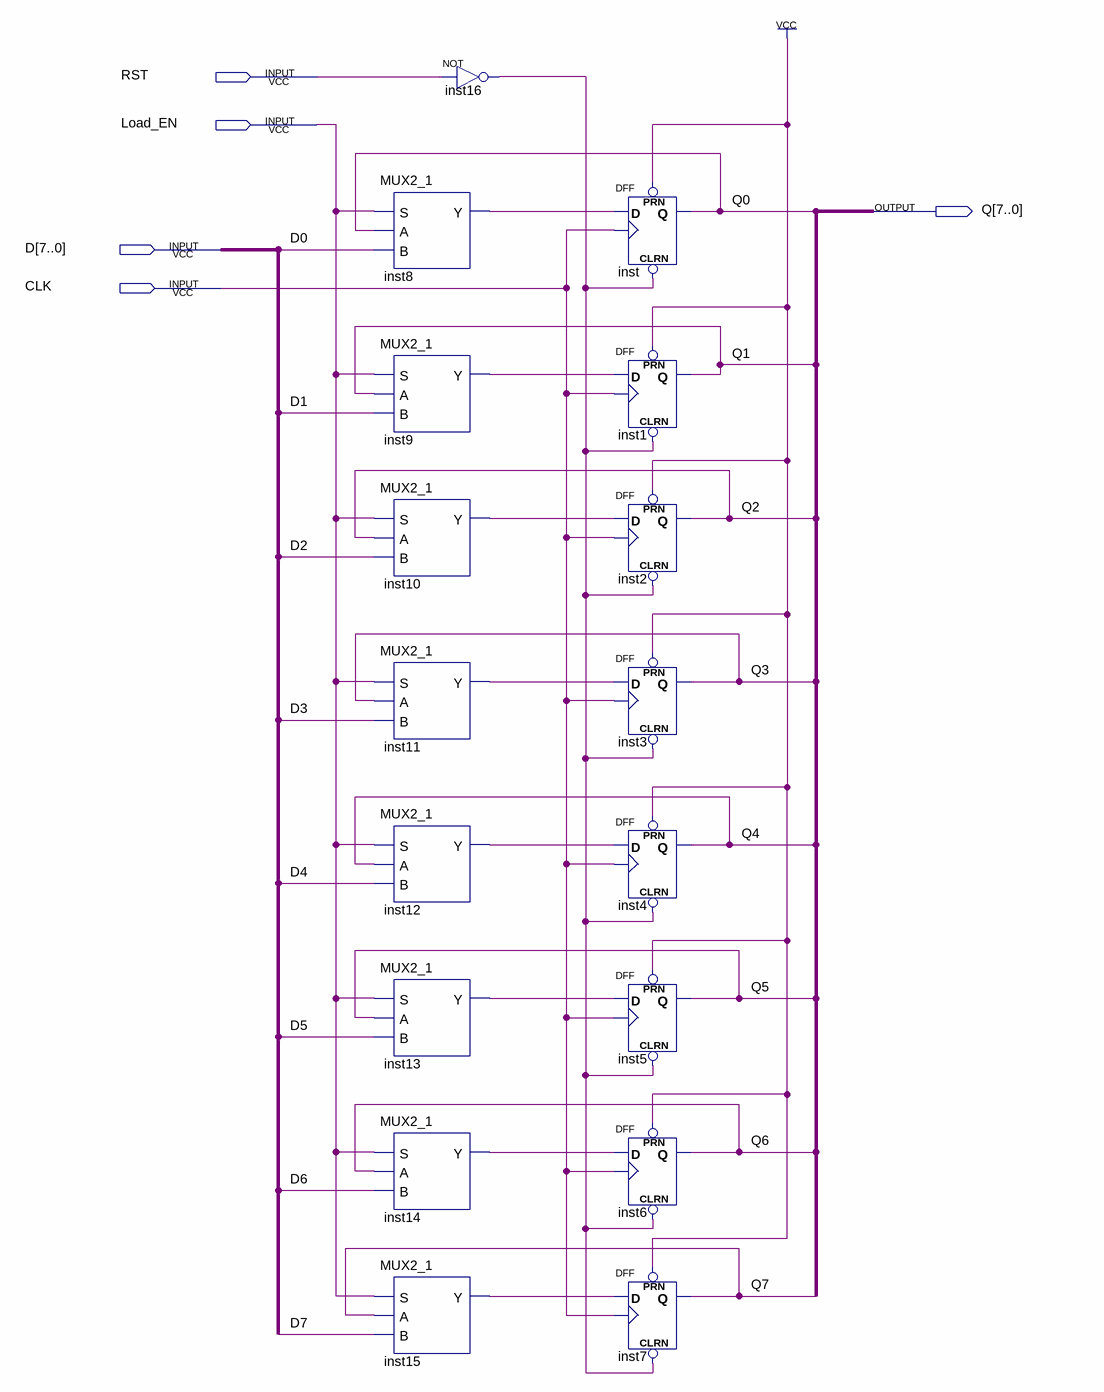
[diagram p0: schematic sheet]
// Quartus schematic register_8_bit.bdf as structural Verilog: 17 symbols, 5 pins
module register_8_bit (
  input  RST,
  input  Load_EN,
  input  [7:0] D,
  input  CLK,
  output [7:0] Q
);

  wire inst8_y, inst9_y, inst10_y, inst11_y, inst12_y, inst13_y, inst14_y, inst15_y, inst16_out;

  MUX2_1 inst8 (.S(Load_EN), .A(Q[0]), .B(D[0]), .Y(inst8_y));
  MUX2_1 inst9 (.S(Load_EN), .A(Q[1]), .B(D[1]), .Y(inst9_y));
  MUX2_1 inst10 (.S(Load_EN), .A(Q[2]), .B(D[2]), .Y(inst10_y));
  MUX2_1 inst11 (.S(Load_EN), .A(Q[3]), .B(D[3]), .Y(inst11_y));
  MUX2_1 inst12 (.S(Load_EN), .A(Q[4]), .B(D[4]), .Y(inst12_y));
  MUX2_1 inst13 (.S(Load_EN), .A(Q[5]), .B(D[5]), .Y(inst13_y));
  MUX2_1 inst14 (.S(Load_EN), .A(Q[6]), .B(D[6]), .Y(inst14_y));
  MUX2_1 inst15 (.S(Load_EN), .A(Q[7]), .B(D[7]), .Y(inst15_y));
  not inst16 (inst16_out, RST);
  DFF inst (.CLRN(inst16_out), .CLK(CLK), .D(inst8_y), .PRN(1'b1), .Q(Q[0]));
  DFF inst1 (.CLRN(inst16_out), .CLK(CLK), .D(inst9_y), .PRN(1'b1), .Q(Q[1]));
  DFF inst2 (.CLRN(inst16_out), .CLK(CLK), .D(inst10_y), .PRN(1'b1), .Q(Q[2]));
  DFF inst3 (.CLRN(inst16_out), .CLK(CLK), .D(inst11_y), .PRN(1'b1), .Q(Q[3]));
  DFF inst4 (.CLRN(inst16_out), .CLK(CLK), .D(inst12_y), .PRN(1'b1), .Q(Q[4]));
  DFF inst5 (.CLRN(inst16_out), .CLK(CLK), .D(inst13_y), .PRN(1'b1), .Q(Q[5]));
  DFF inst6 (.CLRN(inst16_out), .CLK(CLK), .D(inst14_y), .PRN(1'b1), .Q(Q[6]));
  DFF inst7 (.CLRN(inst16_out), .CLK(CLK), .D(inst15_y), .PRN(1'b1), .Q(Q[7]));
endmodule
